# Altium schematic sheet Block Diagram.SchDoc: Block diagram
size A4; Engineer: Naif Aljophani; DocumentNumber: 1; Revision: V1.0; SheetNumber: 1; SheetTotal: 7
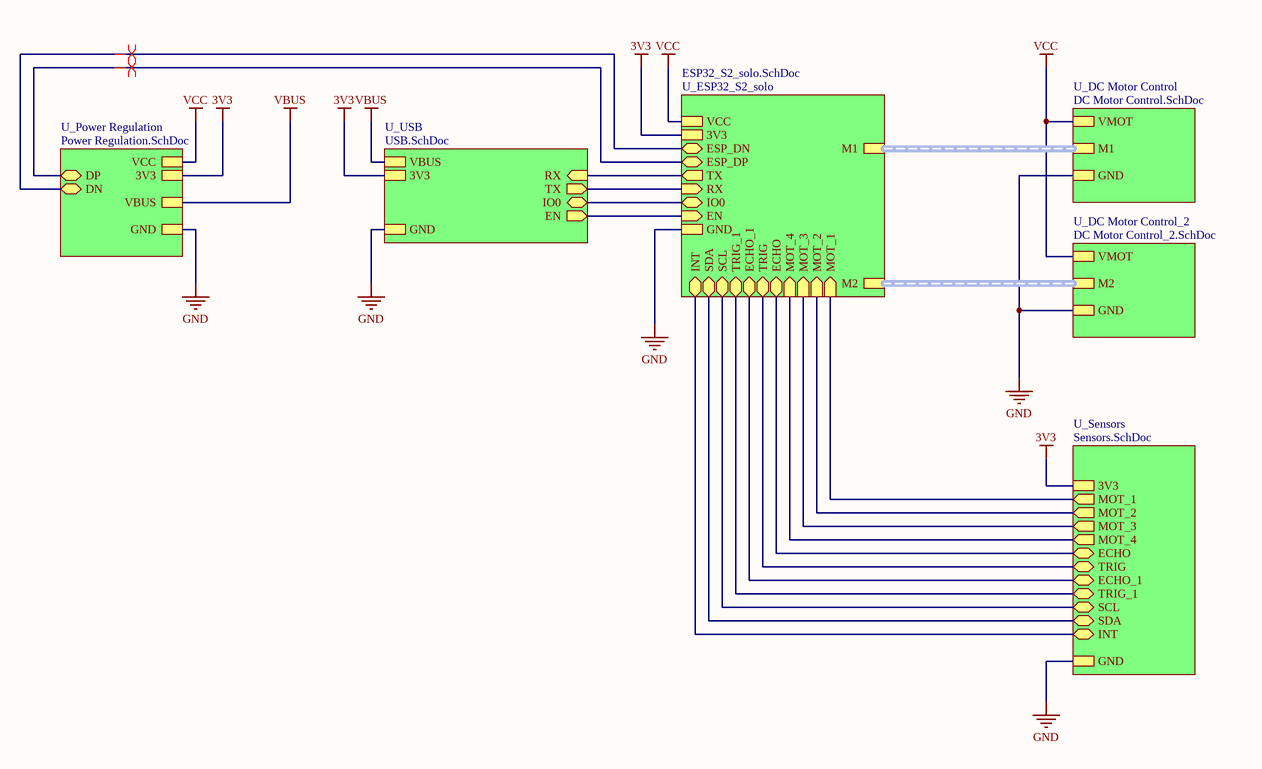
[diagram p0: Block Diagram.SchDoc]

## Sub-sheets
U_DC Motor Control = DC Motor Control.SchDoc: VMOT, GND, M1 (harness M1)
U_DC Motor Control_2 = DC Motor Control_2.SchDoc: VMOT, GND, M2 (harness M2)
U_ESP32_S2_solo = ESP32_S2_solo.SchDoc: 3V3, GND, VCC, IO0 (bidir), EN (in), TX (out), RX (in), M1 (harness M1), M2 (harness M2), ESP_DN (bidir), ESP_DP (bidir), MOT_1 (in), MOT_2 (in), MOT_3 (in), MOT_4 (in), TRIG (bidir), ECHO (bidir), TRIG_1 (bidir), ECHO_1 (bidir), SDA (bidir), INT (bidir), SCL (bidir)
U_Power Regulation = Power Regulation.SchDoc: 3V3, GND, VCC, VBUS, DP (bidir), DN (bidir)
U_Sensors = Sensors.SchDoc: 3V3, MOT_1 (out), MOT_2 (out), MOT_3 (out), MOT_4 (out), GND, TRIG (bidir), ECHO (bidir), TRIG_1 (bidir), ECHO_1 (bidir), SDA (bidir), INT (bidir), SCL (bidir)
U_USB = USB.SchDoc: GND, EN (out), IO0 (bidir), VBUS, RX (in), TX (out), 3V3

## Nets
3V3: sheet U_ESP32_S2_solo/3V3, sheet U_Power Regulation/3V3, sheet U_USB/3V3, sheet U_Sensors/3V3
GND: sheet U_ESP32_S2_solo/GND, sheet U_Power Regulation/GND, sheet U_USB/GND, sheet U_DC Motor Control/GND, sheet U_DC Motor Control_2/GND, sheet U_Sensors/GND
VBUS: sheet U_Power Regulation/VBUS, sheet U_USB/VBUS
VCC: sheet U_ESP32_S2_solo/VCC, sheet U_Power Regulation/VCC, sheet U_DC Motor Control/VMOT, sheet U_DC Motor Control_2/VMOT
(unnamed): sheet U_ESP32_S2_solo/IO0, sheet U_USB/IO0
(unnamed): sheet U_ESP32_S2_solo/EN, sheet U_USB/EN
(unnamed): sheet U_ESP32_S2_solo/TX, sheet U_USB/RX
(unnamed): sheet U_ESP32_S2_solo/RX, sheet U_USB/TX
(unnamed): sheet U_ESP32_S2_solo/ESP_DN, sheet U_Power Regulation/DN
(unnamed): sheet U_ESP32_S2_solo/ESP_DP, sheet U_Power Regulation/DP
(unnamed): sheet U_ESP32_S2_solo/MOT_1, sheet U_Sensors/MOT_1
(unnamed): sheet U_ESP32_S2_solo/MOT_2, sheet U_Sensors/MOT_2
(unnamed): sheet U_ESP32_S2_solo/MOT_3, sheet U_Sensors/MOT_3
(unnamed): sheet U_ESP32_S2_solo/MOT_4, sheet U_Sensors/MOT_4
(unnamed): sheet U_ESP32_S2_solo/TRIG, sheet U_Sensors/TRIG
(unnamed): sheet U_ESP32_S2_solo/ECHO, sheet U_Sensors/ECHO
(unnamed): sheet U_ESP32_S2_solo/TRIG_1, sheet U_Sensors/TRIG_1
(unnamed): sheet U_ESP32_S2_solo/ECHO_1, sheet U_Sensors/ECHO_1
(unnamed): sheet U_ESP32_S2_solo/SDA, sheet U_Sensors/SDA
(unnamed): sheet U_ESP32_S2_solo/INT, sheet U_Sensors/INT
(unnamed): sheet U_ESP32_S2_solo/SCL, sheet U_Sensors/SCL

## Buses and harness runs
harness sheet U_DC Motor Control/M1 = sheet U_ESP32_S2_solo/M1
harness sheet U_DC Motor Control_2/M2 = sheet U_ESP32_S2_solo/M2

## Layout directives
differential pair: (no net found under the mark)